# Altium schematic sheet ESP32_EC.SchDoc (part 1 of 3)
size A3; SheetNumber: 1; SheetTotal: 1
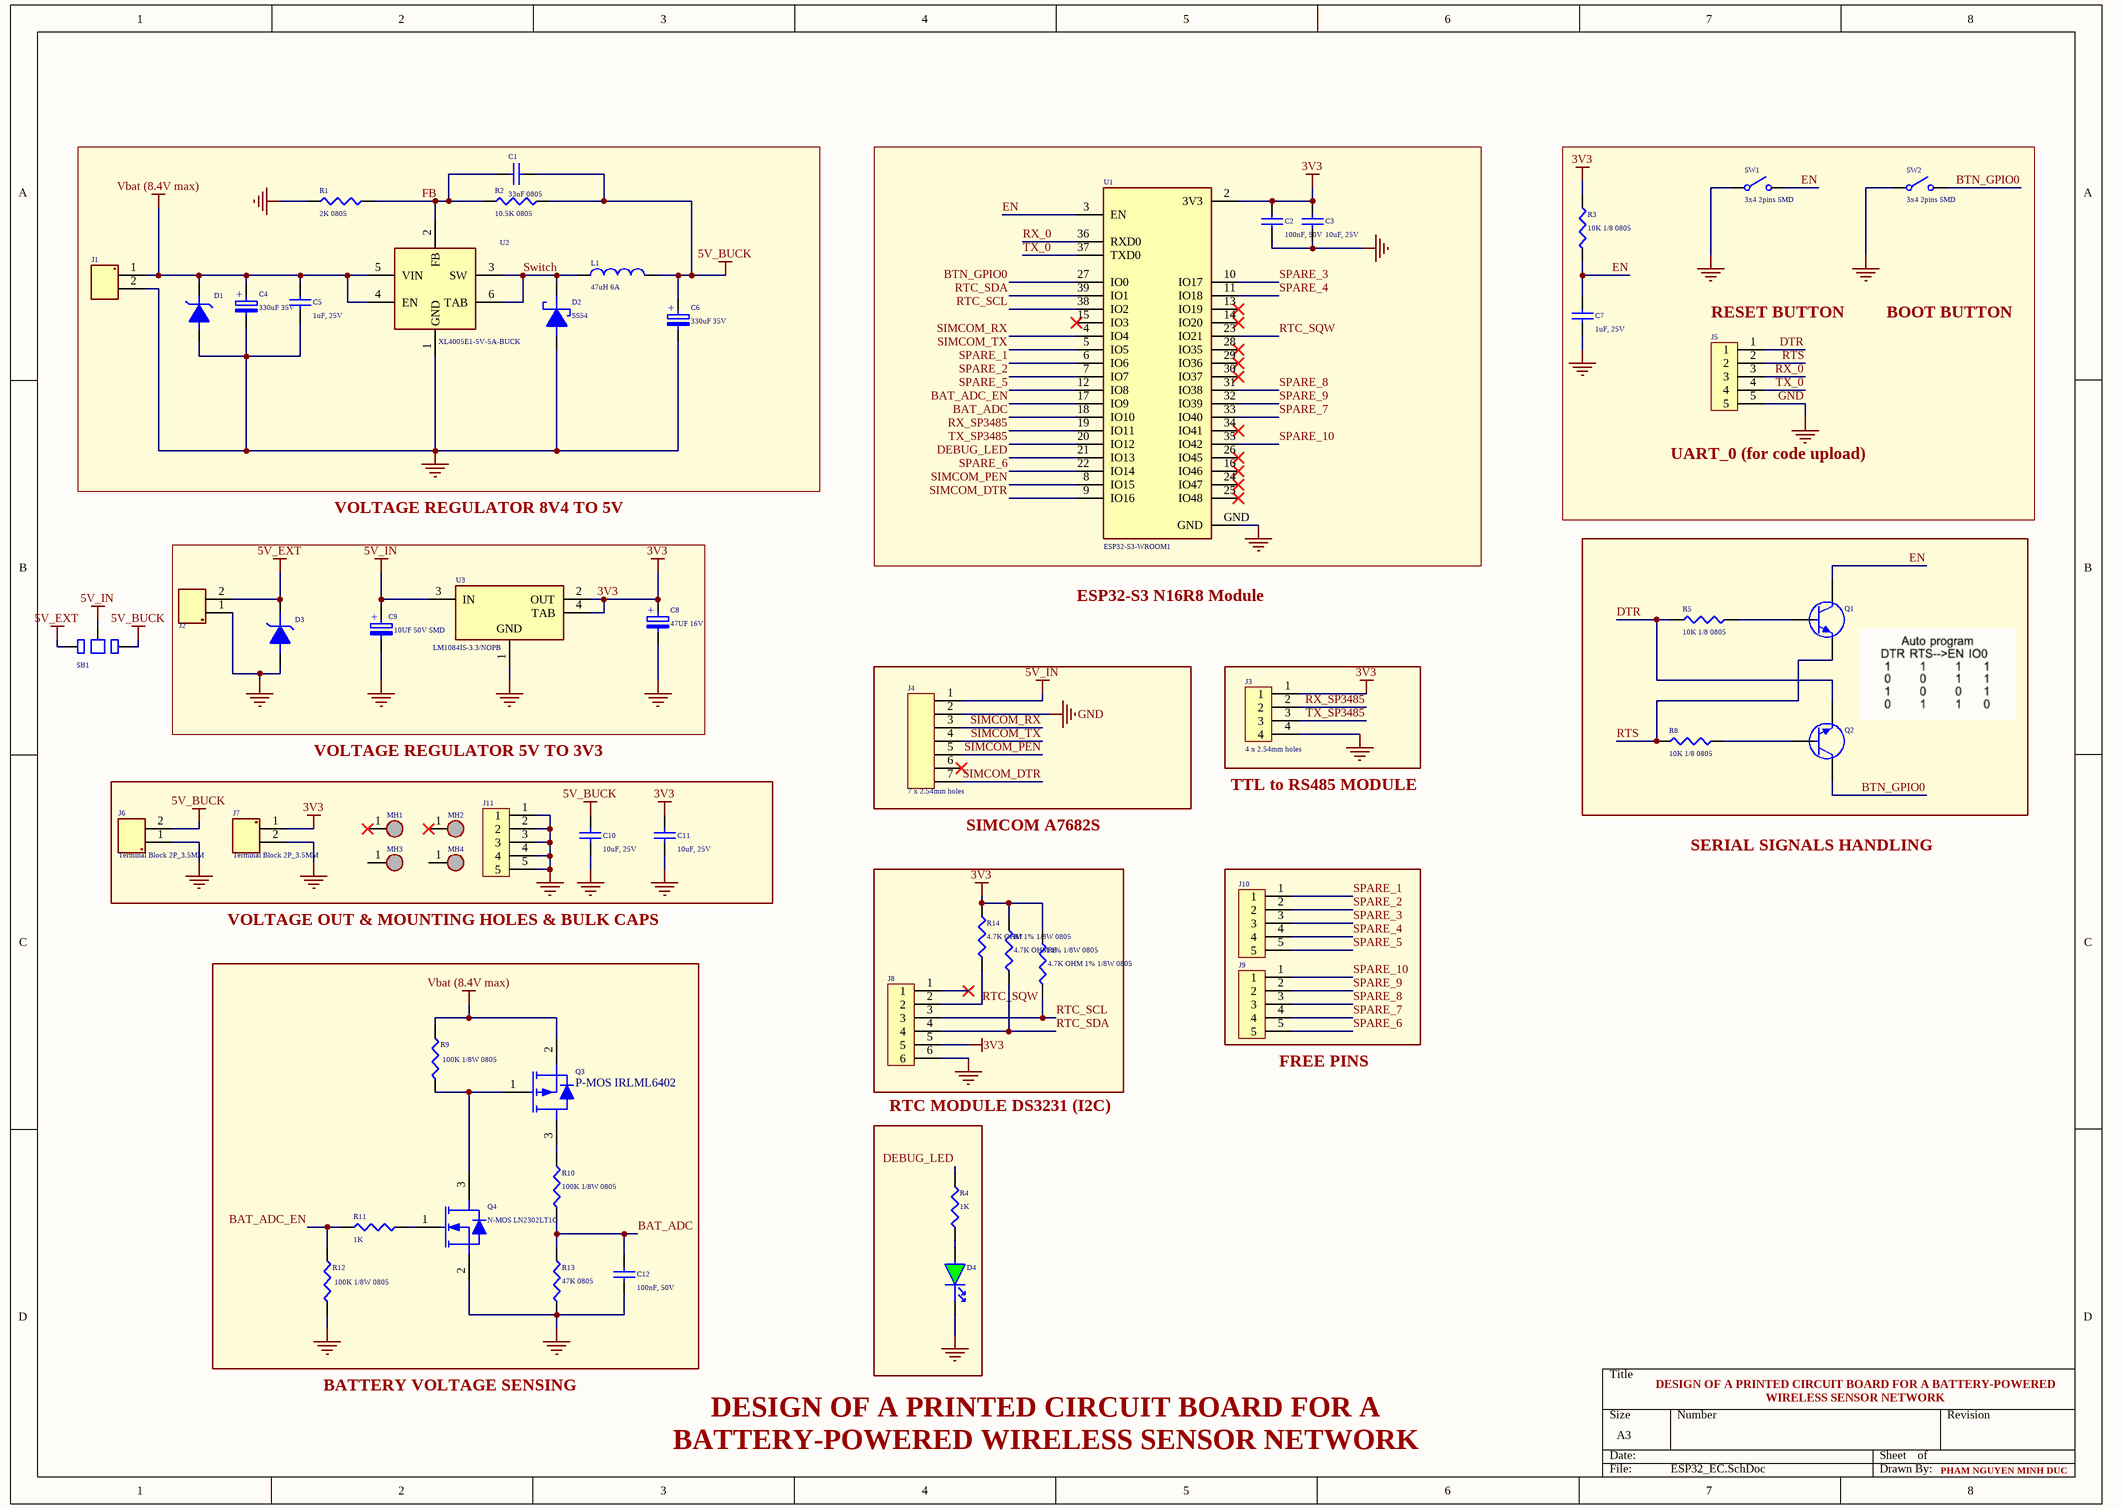
[diagram p0: ESP32_EC.SchDoc]

## Parts
C1  33nF 0805  [CERAMIC_CAP_0805_2012_METRIC]
C2  100nF, 50V  [CERAMIC_CAP_0805_2012_METRIC]
C3  10uF, 25V  [CAPC2012X140N]
C4  330uF 35V  [AEC_CAP_D10xL10P2]
C5  1uF, 25V  [CERAMIC_CAP_0805_2012_METRIC]
C6  330uF 35V  [AEC_CAP_D10xL10P2]
C7  1uF, 25V  [CERAMIC_CAP_0805_2012_METRIC]
C8  47UF 16V  [AEC_CAP_D5XL6P10]
C9  10UF 50V SMD  [AEC_CAP_D5XL6P10]
C10  10uF, 25V  [CAPC2012X140N]
C11  10uF, 25V  [CAPC2012X140N]
C12  100nF, 50V  [CERAMIC_CAP_0805_2012_METRIC]
D1  SMAJ12A  [DO-214AC, SMA]  (value not drawn)
D2  SS54  [DO-214AC, SMA]
D3  SMAJ5A  [DO-214AC, SMA]  (value not drawn)
D4  LED GREEN CLEAR 0805 SMD  [LED 0805]  (value not drawn)
J1  Screw Terminal Blocks  [TERMINAL BLOCK 2P5.0mm]  (value not drawn)
J2  Screw Terminal Blocks  [TERMINAL BLOCK 2P5.0mm]  (value not drawn)
J3  4 x 2.54mm holes  [4 x 2.54mm holes]
J4  7 x 2.54mm holes  [7 x 2.54mm holes]
J5  5 x 2.54mm holes  [5 x 2.54mm holes]  (value not drawn)
J6  Terminal Block 2P_3.5MM  [TERMINAL BLOCK 2P3.5MM]
J7  Terminal Block 2P_3.5MM  [TERMINAL BLOCK 2P3.5MM]
J8  6 x 2.54mm holes  [6 x 2.54mm holes]  (value not drawn)
J9  5 x 2.54mm holes  [5 x 2.54mm holes]  (value not drawn)
J10  5 x 2.54mm holes  [5 x 2.54mm holes]  (value not drawn)
J11  5 x 2.54mm holes  [5 x 2.54mm holes]  (value not drawn)
L1  47uH 6A  [15x8mm Toroidal Inductor]
MH1  MH_5mm x 2.2mm M2  [MH_7P5MMX3P2MM]  (value not drawn)  (no BOM)
MH2  MH_5mm x 2.2mm M2  [MH_7P5MMX3P2MM]  (value not drawn)  (no BOM)
MH3  MH_5mm x 2.2mm M2  [MH_7P5MMX3P2MM]  (value not drawn)  (no BOM)
MH4  MH_5mm x 2.2mm M2  [MH_7P5MMX3P2MM]  (value not drawn)  (no BOM)
Q1  TRANS NPN 25V 1.5A SOT23-3  [FP-SS8050-G-IPC_A]  (value not drawn)
Q2  TRANS NPN 25V 1.5A SOT23-3  [FP-SS8050-G-IPC_A]  (value not drawn)
Q3  P-MOS IRLML6402  [FP-SS8050-G-IPC_A]
Q4  N-MOS LN2302LT1G  [FP-SS8050-G-IPC_A]
R1  2K 0805  [0805_RES_1/8W]
R2  10.5K 0805  [0805_RES_1/8W]
R3  10K 1/8 0805  [0805_RES_1/8W]
R4  1K  [0805_RES_1/8W]
R5  10K 1/8 0805  [0805_RES_1/8W]
R6  4.7K OHM 1% 1/8W 0805  [0805_RES_1/8W]
R7  4.7K OHM 1% 1/8W 0805  [0805_RES_1/8W]
R8  10K 1/8 0805  [0805_RES_1/8W]
R9  100K 1/8W 0805  [0805_RES_1/8W]
R10  100K 1/8W 0805  [0805_RES_1/8W]
R11  1K  [0805_RES_1/8W]
R12  100K 1/8W 0805  [0805_RES_1/8W]
R13  47K 0805  [0805_RES_1/8W]
R14  4.7K OHM 1% 1/8W 0805  [0805_RES_1/8W]
SB1  3 Terminals Solder Bridge  [3 Terminals Solder Bridge 4A (Open)]  (value not drawn)
SW1  3x4 2pins SMD  [SMD_TACTILEBUT_3X4X2P5MM]
SW2  3x4 2pins SMD  [SMD_TACTILEBUT_3X4X2P5MM]
U1  ESP32-S3-WROOM1  [ESP32-S3-WROOM-1-N16R8]
U2  XL4005E1-5V-5A-BUCK  [TO-263-5L - Difference 3D Model]
U3  LM1084IS-3.3/NOPB  [TO-263 (D2PAK)]

## Blocks framed on the sheet
RTC MODULE DS3231 (I2C): D4 R4

## Nets
3V3: C2.2 C3.1 C8.1(A) C11.1 J3.1 J7.1 J8.5 R3.2 R6.2 R7.2 R14.2 U1.2(3V3) U3.2(OUT) U3.4(TAB)
5V_BUCK: C1.1 C6.1(A) C10.1 J6.2 L1.2 R2.2 SB1.2
5V_EXT: D3.2 J2.2 SB1.1
5V_IN: C9.1(A) J4.1 SB1.3 U3.3(IN)
GND: C2.1 C3.2 C4.2(C) C5.1 C6.2(C) C7.1 C8.2(C) C9.2(C) C10.2 C11.2 C12.1 D1.1 D2.1 D3.1 D4.2 J1.2 J2.1 J3.4 J4.2 J5.5 J6.1 J7.2 J8.6 J11.1 J11.2 J11.3 J11.4 J11.5 Q4.2(S) R1.1 R12.1 R13.1 SW1.1 SW2.1 U1.GND U2.1(GND) U3.1(GND)
Vbat (8.4V max): C4.1(A) C5.2 D1.2 J1.1 Q3.2(S) R9.2 U2.4(EN) U2.5(VIN)
BAT_ADC: C12.2 R10.2 R13.2 U1.18(IO10)
BAT_ADC_EN: R11.1 R12.2 U1.17(IO9)
BTN_GPIO0: Q2.3(C) SW2.2 U1.27(IO0)
DEBUG_LED: R4.2 U1.21(IO13)
DTR: J5.1 Q2.2(E) R5.1
EN: C7.2 Q1.3(C) R3.1 SW1.2 U1.3(EN)
FB: C1.2 R1.2 R2.1 U2.2(FB)
RTC_SCL: J8.3 R6.1 U1.38(IO2)
RTC_SDA: J8.4 R7.1 U1.39(IO1)
RTC_SQW: J8.2 R14.1 U1.23(IO21)
RTS: J5.2 Q1.2(E) R8.1
RX_0: J5.3 U1.36(RXD0)
RX_SP3485: J3.2 U1.19(IO11)
SIMCOM_DTR: J4.7 U1.9(IO16)
SIMCOM_PEN: J4.5 U1.8(IO15)
SIMCOM_RX: J4.3 U1.4(IO4)
SIMCOM_TX: J4.4 U1.5(IO5)
SPARE_1: J10.1 U1.6(IO6)
SPARE_2: J10.2 U1.7(IO7)
SPARE_3: J10.3 U1.10(IO17)
SPARE_4: J10.4 U1.11(IO18)
SPARE_5: J10.5 U1.12(IO8)
SPARE_6: J9.5 U1.22(IO14)
SPARE_7: J9.4 U1.33(IO40)
SPARE_8: J9.3 U1.31(IO38)
SPARE_9: J9.2 U1.32(IO39)
SPARE_10: J9.1 U1.35(IO42)
Switch: D2.2 L1.1 U2.3(SW) U2.6(TAB)
TX_0: J5.4 U1.37(TXD0)
TX_SP3485: J3.3 U1.20(IO12)
NetD4_1: D4.1 R4.1
NetQ1_1: Q1.1(B) R5.2
NetQ2_1: Q2.1(B) R8.2
NetQ3_1: Q3.1(G) Q4.3(D) R9.1
NetQ3_3: Q3.3(D) R10.1
NetQ4_1: Q4.1(G) R11.2

Not connected (* = marked no-connect by the designer): J4 6*; J8 1*; MH1 1*; MH2 1*; MH3 1; MH4 1; U1 13(IO19)* 14(IO20)* 15(IO3)* 16(IO46)* 24(IO47)* 25(IO48)* 26(IO45)* 28(IO35)* 29(IO36)* 30(IO37)* 34(IO41)*

## Notes on the sheet
- (near C3) 35 36 37 are connected to Octal PSRAM
- (near R3) Strapping Pins
  GPIO 0 GPIO 3
  GPIO 45 GPIO 46
  GPIO41 must LOW during boot
- (near R3) IO47/48 working voltage is 1.8V
- (near R3) UART Port	TX	RX	Remarks
  UART0 (booting)	GPIO 43	GPIO 44	Cannot be changed
  UART1		GPIO 17	GPIO 18	Can be assigned to other GPIOs
  UART2		—	—	Assign any pins of your choice
- (near R3) PI		MOSI	MISO	CLK	CS
  HSPI (SPI 2)	GPIO 11	GPIO 13	GPIO 12	GPIO 10
  VSPI (SPI 3)	GPIO 35	GPIO 37	GPIO 36	GPIO 39
  SPI0,1 not use for external purposes
- (near J5) RESET BUTTON
- BOOT BUTTON
- VOLTAGE REGULATOR 8V4 TO 5V
- This circuit is a standard RC (Resistor-Capacitor) Delay Network, and for an ESP32, its primary job is to handle the Power-On Reset (POR).
  Because the ESP32 is a complex System-on-Chip (SoC), it needs its power supply voltage (3.3V) to be fully stable before it starts booting. If the chip tries to start while the voltage is still "climbing," it can end up in a glitched state or a "brownout" loop.
  How it Works
  At Power-Up: The capacitor (C7) is empty. It acts like a short circuit to ground, keeping the EN (Enable/Reset) pin at 0V (Low).
  The Delay: As current flows through the 10kΩ resistor (R3), the capacitor begins to charge. The voltage at the EN pin rises slowly.
  The Release: Once the voltage across the capacitor reaches the ESP32’s high-level threshold (typically around 0.75×VDD), the chip finally "wakes up" and begins the boot process.
  Why These Specific Values?
  The time constant (τ) for this circuit is:
  τ=R×C=10,000Ω×0.000001F=10ms
- (near J5) UART_0 (for code upload)
- ESP32-S3 N16R8 Module
- VOLTAGE REGULATOR 5V TO 3V3
- (near J4) SIMCOM A7682S
- PEN : Power Enable (Active Low)
  NET : Network LED (Blinking Behavior)
  DTR : Data Terminal Ready (HIGH: Sleep, LOW: Awake AT+CSCLK=1)
  For Short Break (just Sleep)
  For Long Break (overnight, choose Shutdown)
- (near J3) TTL to RS485 MODULE
- SERIAL SIGNALS HANDLING
- VOLTAGE OUT & MOUNTING HOLES & BULK CAPS
- (near J9) FREE PINS
- BATTERY VOLTAGE SENSING
- DESIGN OF A PRINTED CIRCUIT BOARD FOR A BATTERY-POWERED WIRELESS SENSOR NETWORK
- PHAM NGUYEN MINH DUC
- (in symbol 16SVPG47M) +
- (in symbol EEH-ZA1H100R) +
- (in symbol EEH-ZS1V331P) +